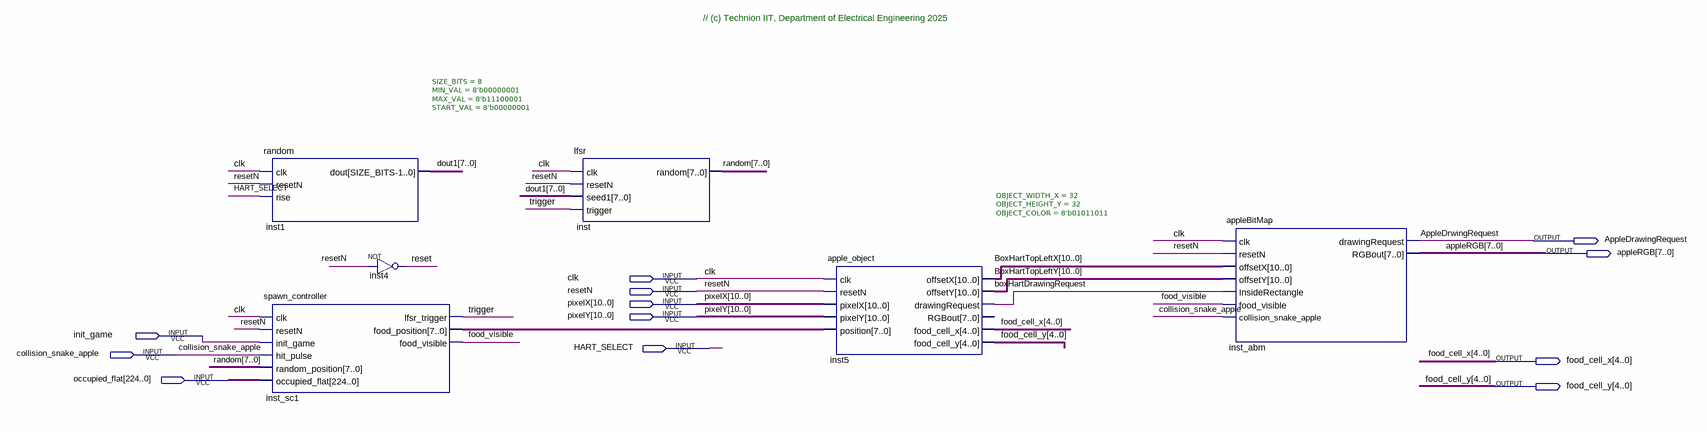
[diagram p0: schematic sheet]
// Quartus schematic APPLE_DISPLAY.bdf as structural Verilog: 6 symbols, 12 pins
module APPLE_DISPLAY (
  input  clk,
  input  resetN,
  input  [10:0] pixelX,
  input  [10:0] pixelY,
  input  init_game,
  input  HART_SELECT,
  input  collision_snake_apple,
  input  [224:0] occupied_flat,
  output AppleDrawingRequest,
  output [7:0] appleRGB,
  output [4:0] food_cell_x,
  output [4:0] food_cell_y
);

  wire boxHartDrawingRequest, food_visible, reset, trigger;
  wire [7:0] dout1, inst_sc1_food_position, random;
  wire [10:0] BoxHartTopLeftX, BoxHartTopLeftY;

  random #(.SIZE_BITS(8), .MIN_VAL(8'b00000001), .MAX_VAL(8'b11100001), .START_VAL(8'b00000001)) inst1 (
    .clk(clk), .resetN(resetN), .rise(HART_SELECT), .dout(dout1));
  spawn_controller inst_sc1 (
    .clk(clk), .resetN(resetN), .init_game(init_game), .hit_pulse(collision_snake_apple),
    .random_position(random), .occupied_flat(occupied_flat), .lfsr_trigger(trigger),
    .food_position(inst_sc1_food_position), .food_visible(food_visible));
  not inst4 (reset, resetN);
  lfsr inst (.clk(clk), .resetN(resetN), .seed1(dout1), .trigger(trigger), .random(random));
  apple_object #(.OBJECT_WIDTH_X(32), .OBJECT_HEIGHT_Y(32), .OBJECT_COLOR(8'b01011011)) inst5 (
    .clk(clk), .resetN(resetN), .pixelX(pixelX), .pixelY(pixelY), .position(inst_sc1_food_position),
    .offsetX(BoxHartTopLeftX), .offsetY(BoxHartTopLeftY), .drawingRequest(boxHartDrawingRequest),
    .food_cell_x(food_cell_x), .food_cell_y(food_cell_y));  // open: RGBout
  appleBitMap inst_abm (
    .clk(clk), .resetN(resetN), .offsetX(BoxHartTopLeftX), .offsetY(BoxHartTopLeftY),
    .InsideRectangle(boxHartDrawingRequest), .food_visible(food_visible),
    .collision_snake_apple(collision_snake_apple), .drawingRequest(AppleDrawingRequest), .RGBout(appleRGB));

  // Other names for the same wires on the sheet: AppleDrwingRequest = AppleDrawingRequest

  // Notes on the sheet:
  //   // (c) Technion IIT, Department of Electrical Engineering 2025
endmodule
